# EasyEDA Pro project BMS-Mainboard.epro, schematic Schematic2
Assembly Variant: Basic; Board Name: Board2; Create Date: 2026-09-27; Page Name: P1; Project Name: BMS 主控板; Schematic Name: Schematic2; Update Date: 2026-09-27; Company: 嘉立创EDA; Page Size: A4; Version: V1.0
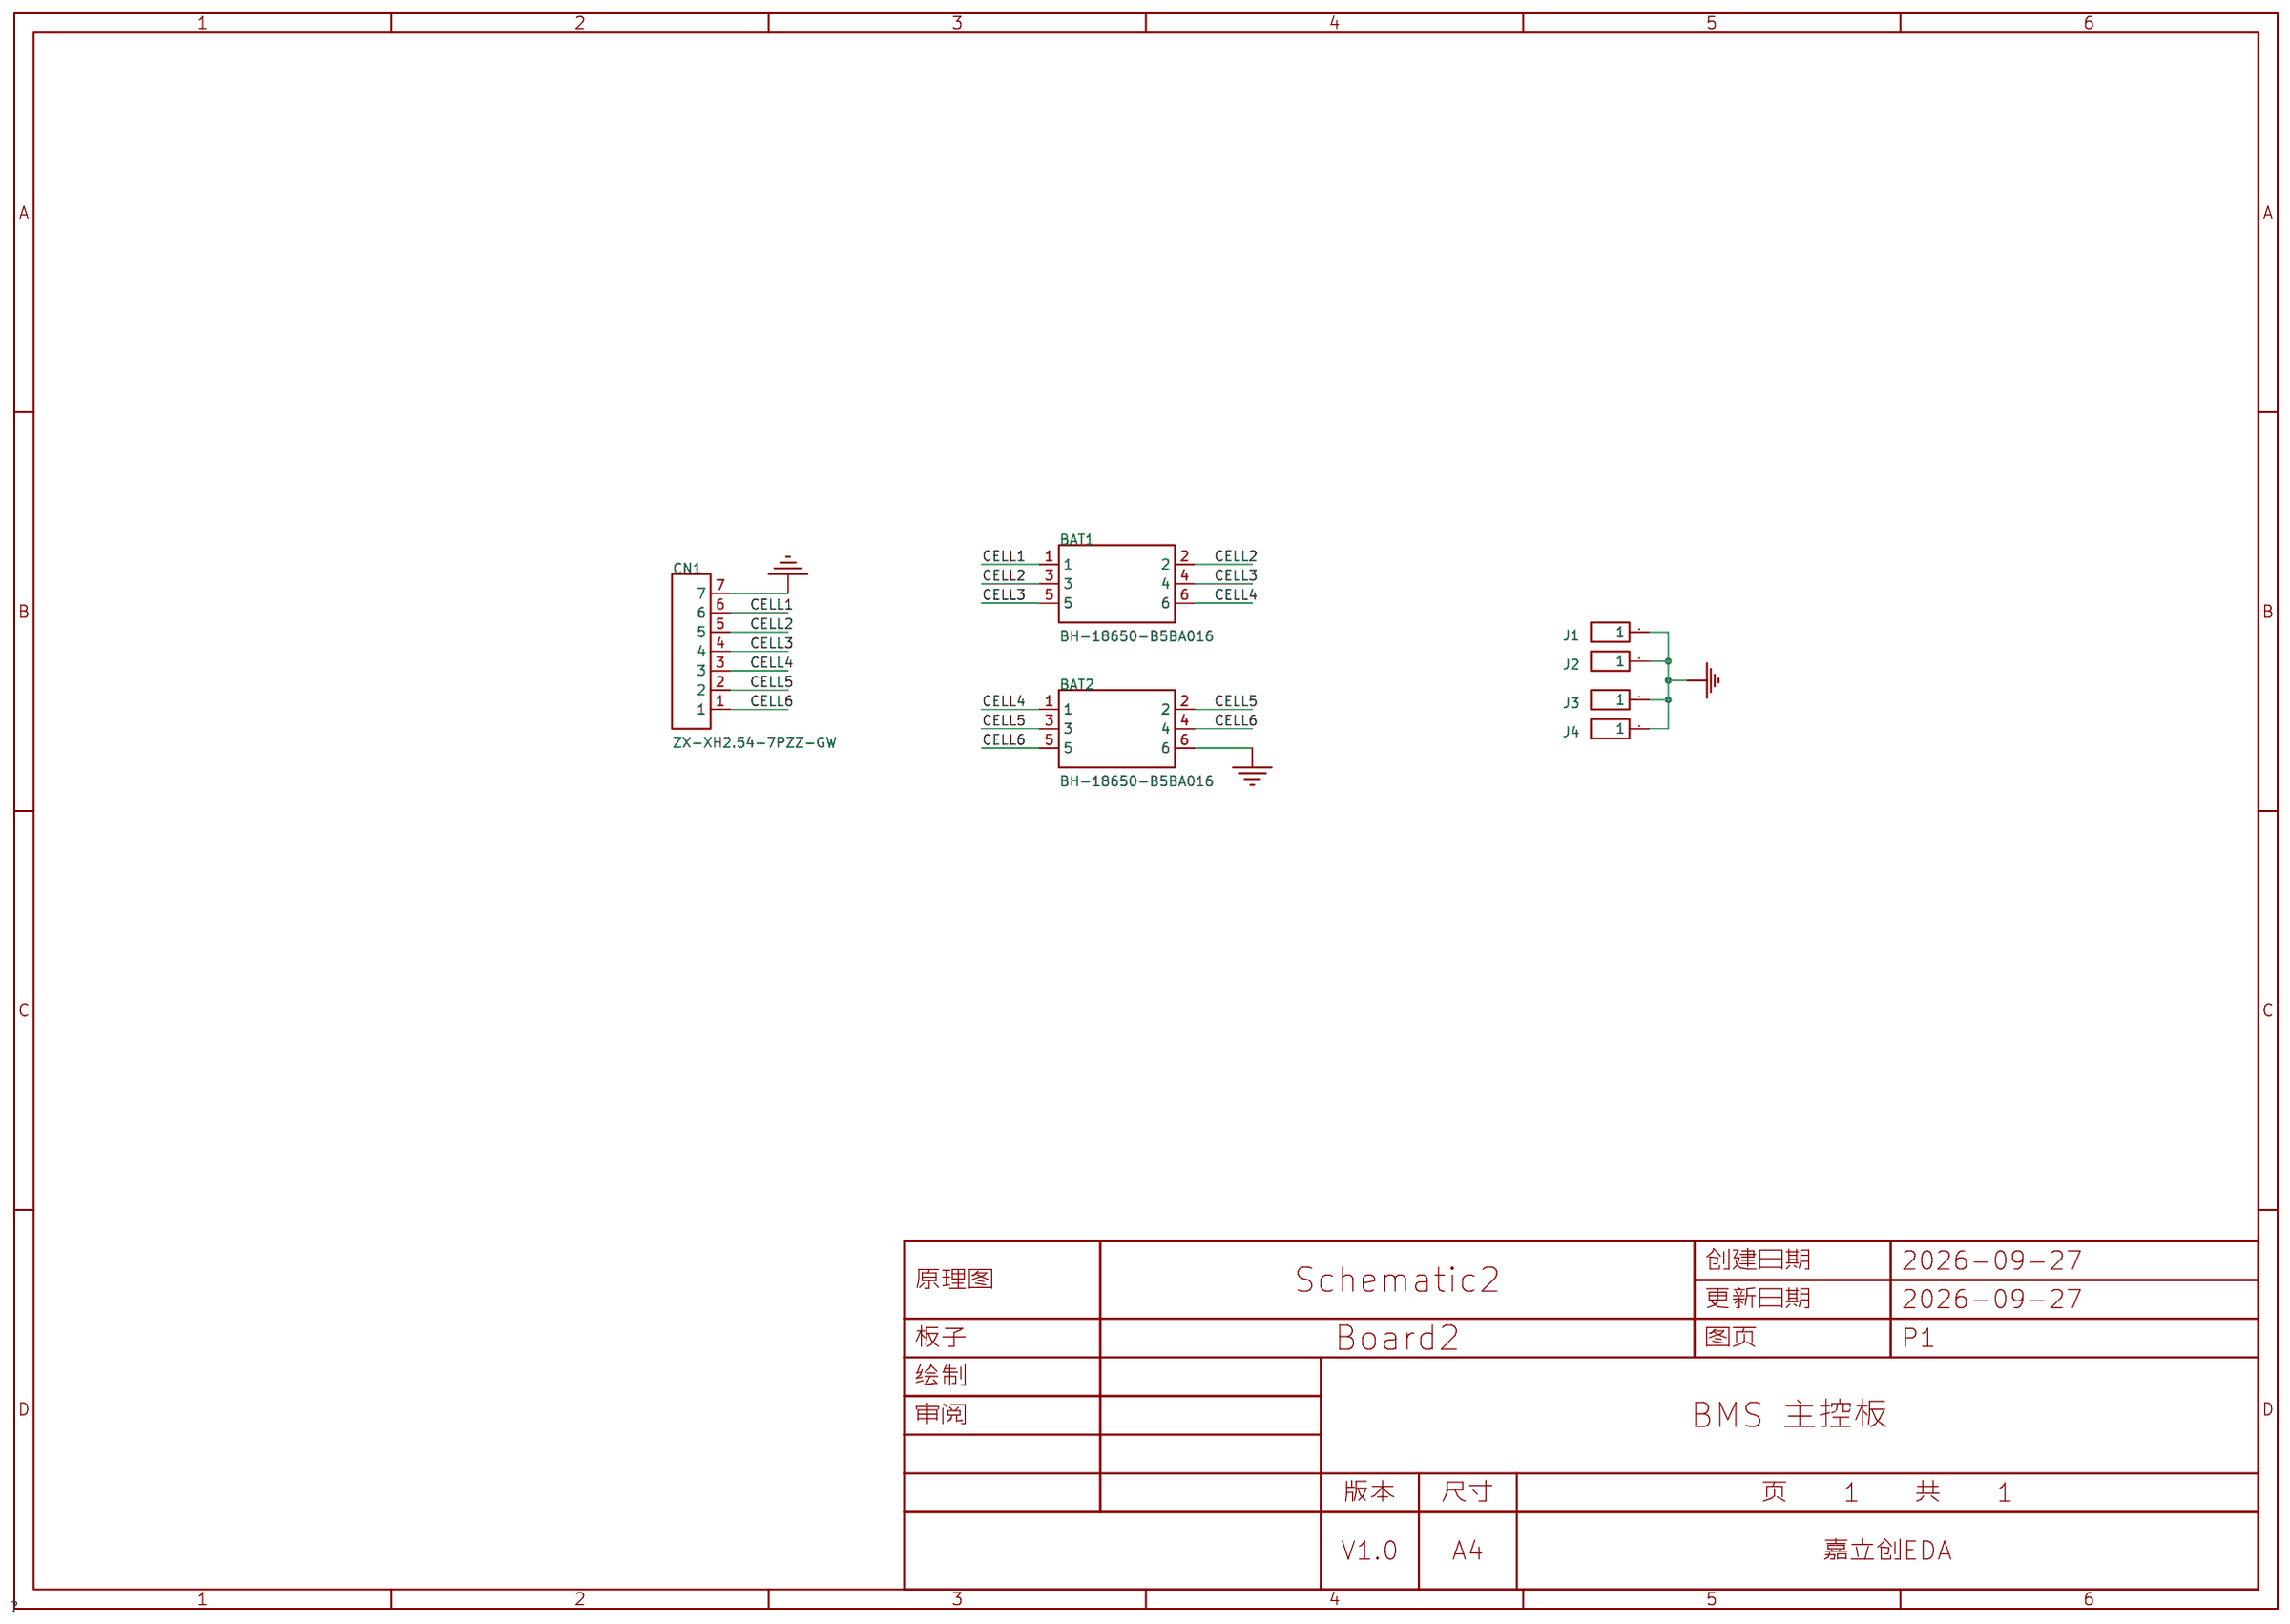
[diagram p0: schematic sheet]

## Parts
BAT1  BH-18650-B5BA016  [BAT-SMD_BH-18650-B5BA016]
BAT2  BH-18650-B5BA016  [BAT-SMD_BH-18650-B5BA016]
CN1  ZX-XH2.54-7PZZ-GW  [CONN-TH_7P-P2.50_HCTL_XH-7A]
J1  HDR-M-2.54_1x1  [定位孔]
J2  HDR-M-2.54_1x1  [定位孔]
J3  HDR-M-2.54_1x1  [定位孔]
J4  HDR-M-2.54_1x1  [定位孔]

## Library data of the parts
BAT1 BAT2 = BH-18650-B5BA016: 电池盒BHPA46 Au SMT /适用电池18650平头电芯//电池底座/ 卧式自动化生产贴片电池盒/符合耐高温SMT回流焊工艺，材质：不锈钢304，PA46/镀金/黑色/; LCSC Part Name: MYOUNG(美阳) 电池盒BH-18650-3J PA46 Au 适用电池18650平头电芯 电池底座 卧式自动化生产贴片电池盒 符合低温180° SMT回流焊工艺 适配18650电池; Supplier Part: C19184086; Manufacturer: MYOUNG(美阳); JLCPCB Part Class: Extended Part; Datasheet: https://item.szlcsc.com/datasheet/BH-18650-B5BA016/20398492.html; Supplier: LCSC; Type: 电池盒; Operating Temperature: -25~85℃; Contact coating: 镀金
CN1 = ZX-XH2.54-7PZZ-GW: 插针结构:1x7P;间距:2.5mm;安装方式:直插;参考系列:XH;总PIN数:7P;排数:1;每排PIN数:7;行距:-;额定电流:3A;触头材质:铜合金;触头镀层:锡;工作温度:-25℃~+85℃;; LCSC Part Name: 1x7P 间距:2.5mm 直插 系列:XH; Supplier Part: C42441534; Manufacturer: Megastar(兆星); Supplier Footprint: 插件,P=2.5mm; JLCPCB Part Class: Extended Part; Datasheet: https://item.szlcsc.com/datasheet/ZX-XH2.54-7PZZ-GW/44490573.html; Supplier: LCSC; Pins Structure: 1x7P; Pitch: 2.5mm; Mounting Type: 直插; Reference Series: XH; Number of Pins: 7P; Number of Rows: 1; Number of PINs Per Row: 7; Current Rating: 3A; Contact Material: 铜合金; Contact Plating: 锡; Operating Temperature: -25℃~+85℃; Voltage Rating: 250V; Plastic Material: PA66; Flame Retardant Rating: UL94V-0; Color: 米色; Z-Height of the Board: 7mm; X-Length of Bottom Edge on Board (Spacing Line): 20mm; Y-Width of Bottom Edge on Board: 5.75mm
J1-J4 = HDR-M-2.54_1x1: Supplier Part: C81276; Supplier: LCSC

## Nets
GND: BAT2.6 CN1.7 J1.1 J2.1 J3.1 J4.1
CELL1: BAT1.1 CN1.6
CELL2: BAT1.2 BAT1.3 CN1.5
CELL3: BAT1.4 BAT1.5 CN1.4
CELL4: BAT1.6 BAT2.1 CN1.3
CELL5: BAT2.2 BAT2.3 CN1.2
CELL6: BAT2.4 BAT2.5 CN1.1
